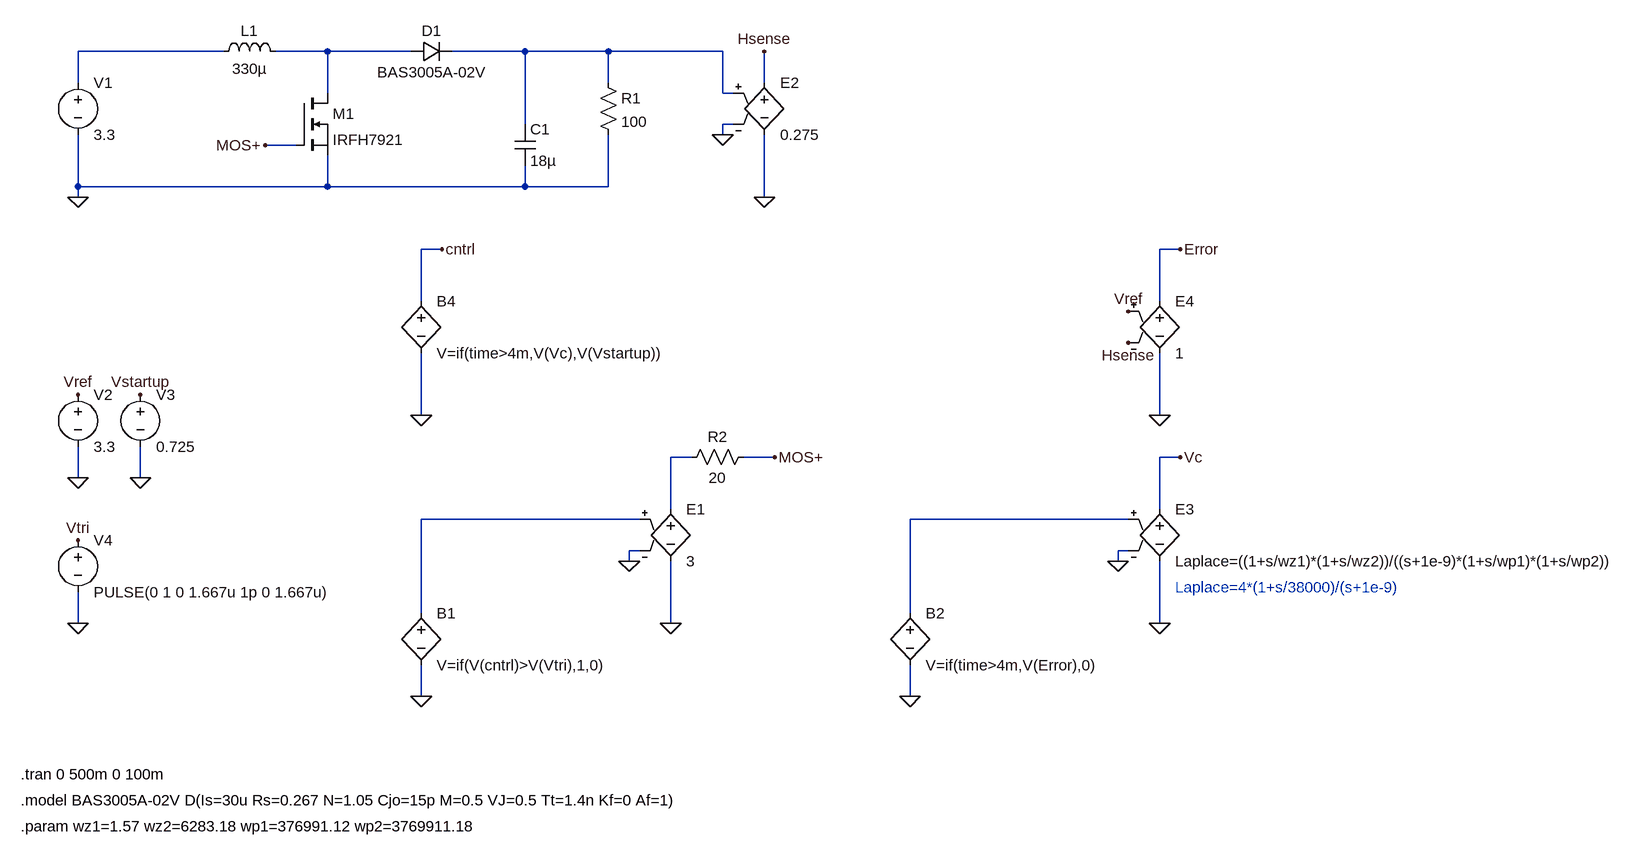
[diagram p0: schematic FDT closed loop.asc]
FDT closed loop.asc, the LTspice schematic file:
Version 4.1
SHEET 1 2152 680
WIRE -480 -576 -704 -576
WIRE -320 -576 -400 -576
WIRE -192 -576 -320 -576
WIRE -16 -576 -128 -576
WIRE 112 -576 -16 -576
WIRE 288 -576 112 -576
WIRE -704 -528 -704 -576
WIRE 112 -528 112 -576
WIRE 352 -528 352 -576
WIRE -320 -512 -320 -576
WIRE 288 -512 288 -576
WIRE 304 -512 288 -512
WIRE -16 -464 -16 -576
WIRE 304 -464 288 -464
WIRE 288 -448 288 -464
WIRE -368 -432 -416 -432
WIRE -704 -368 -704 -448
WIRE -320 -368 -320 -416
WIRE -320 -368 -704 -368
WIRE -16 -368 -16 -400
WIRE -16 -368 -320 -368
WIRE 112 -368 112 -448
WIRE 112 -368 -16 -368
WIRE -704 -352 -704 -368
WIRE 352 -352 352 -448
WIRE -144 -272 -176 -272
WIRE 992 -272 960 -272
WIRE -176 -192 -176 -272
WIRE 960 -192 960 -272
WIRE -176 -16 -176 -112
WIRE 960 -16 960 -112
WIRE 240 48 208 48
WIRE 368 48 320 48
WIRE 992 48 960 48
WIRE -704 80 -704 32
WIRE -608 80 -608 32
WIRE 208 128 208 48
WIRE 960 128 960 48
WIRE 160 144 -176 144
WIRE 912 144 576 144
WIRE 160 192 144 192
WIRE 912 192 896 192
WIRE 144 208 144 192
WIRE 896 208 896 192
WIRE -176 288 -176 144
WIRE 576 288 576 144
WIRE -704 304 -704 256
WIRE 208 304 208 208
WIRE 960 304 960 208
WIRE -176 416 -176 368
WIRE 576 416 576 368
FLAG -416 -432 MOS+
FLAG -704 -352 0
FLAG -704 304 0
FLAG -704 176 Vtri
FLAG -704 80 0
FLAG -704 -48 Vref
FLAG -176 416 0
FLAG 368 48 MOS+
FLAG 208 304 0
FLAG 144 208 0
FLAG 288 -448 0
FLAG 352 -352 0
FLAG 352 -576 Hsense
FLAG 960 304 0
FLAG 896 208 0
FLAG 960 -16 0
FLAG 992 -272 Error
FLAG 912 -176 Vref
FLAG 576 416 0
FLAG 992 48 Vc
FLAG -608 80 0
FLAG -608 -48 Vstartup
FLAG 912 -128 Hsense
FLAG -176 -16 0
FLAG -144 -272 cntrl
SYMBOL voltage -704 -544 R0
WINDOW 123 0 0 Left 0
WINDOW 39 0 0 Left 0
SYMATTR InstName V1
SYMATTR Value 3.3
SYMBOL ind -496 -560 R270
WINDOW 0 32 56 VTop 2
WINDOW 3 5 56 VBottom 2
SYMATTR InstName L1
SYMATTR Value 330µ
SYMBOL diode -192 -560 R270
WINDOW 0 32 32 VTop 2
WINDOW 3 0 32 VBottom 2
SYMATTR InstName D1
SYMATTR Value BAS3005A-02V
SYMBOL cap -32 -464 R0
SYMATTR InstName C1
SYMATTR Value 18µ
SYMBOL res 96 -544 R0
SYMATTR InstName R1
SYMATTR Value 100
SYMBOL nmos -368 -512 R0
SYMATTR InstName M1
SYMATTR Value IRFH7921
SYMBOL voltage -704 160 R0
WINDOW 123 0 0 Left 0
WINDOW 39 0 0 Left 0
SYMATTR InstName V4
SYMATTR Value PULSE(0 1 0 1.667u 1p 0 1.667u)
SYMBOL voltage -704 -64 R0
WINDOW 123 0 0 Left 0
WINDOW 39 0 0 Left 0
SYMATTR InstName V2
SYMATTR Value 3.3
SYMBOL bv -176 272 R0
SYMATTR InstName B1
SYMATTR Value V=if(V(cntrl)>V(Vtri),1,0)
SYMBOL e 208 112 R0
SYMATTR InstName E1
SYMATTR Value 3
SYMBOL e 352 -544 R0
SYMATTR InstName E2
SYMATTR Value 0.275
SYMBOL e 960 112 R0
SYMATTR InstName E3
SYMATTR Value Laplace=((1+s/wz1)*(1+s/wz2))/((s+1e-9)*(1+s/wp1)*(1+s/wp2))
SYMBOL e 960 -208 R0
SYMATTR InstName E4
SYMATTR Value 1
SYMBOL bv 576 272 R0
SYMATTR InstName B2
SYMATTR Value V=if(time>4m,V(Error),0)
SYMBOL voltage -608 -64 R0
WINDOW 123 0 0 Left 0
WINDOW 39 0 0 Left 0
SYMATTR InstName V3
SYMATTR Value 0.725
SYMBOL res 336 32 R90
WINDOW 0 0 56 VBottom 2
WINDOW 3 32 56 VTop 2
SYMATTR InstName R2
SYMATTR Value 20
SYMBOL bv -176 -208 R0
SYMATTR InstName B4
SYMATTR Value V=if(time>4m,V(Vc),V(Vstartup))
TEXT -792 536 Left 2 !.tran 0 500m 0 100m
TEXT -792 576 Left 2 !.model BAS3005A-02V D(Is=30u Rs=0.267 N=1.05 Cjo=15p M=0.5 VJ=0.5 Tt=1.4n Kf=0 Af=1)
TEXT -792 616 Left 2 !.param wz1=1.57 wz2=6283.18 wp1=376991.12 wp2=3769911.18
TEXT 984 248 Left 2 ;Laplace=4*(1+s/38000)/(s+1e-9)

The netlist it stands for:
* FDT closed loop.asc
V1 N001 0 3.3
L1 N001 N002 330µ
D1 N002 N003 BAS3005A-02V
C1 N003 0 18µ
R1 N003 0 100
M1 N002 MOS+ 0 0 IRFH7921
V4 Vtri 0 PULSE(0 1 0 1.667u 1p 0 1.667u)
V2 Vref 0 3.3
B1 N005 0 V=if(V(cntrl)>V(Vtri),1,0)
E1 N004 0 N005 0 3
E2 Hsense 0 N003 0 0.275
E3 Vc 0 N006 0 Laplace=((1+s/wz1)*(1+s/wz2))/((s+1e-9)*(1+s/wp1)*(1+s/wp2))
E4 Error 0 Vref Hsense 1
B2 N006 0 V=if(time>4m,V(Error),0)
V3 Vstartup 0 0.725
R2 MOS+ N004 20
B4 cntrl 0 V=if(time>4m,V(Vc),V(Vstartup))
.model D D
.lib standard.dio
.model NMOS NMOS
.model PMOS PMOS
.lib standard.mos
.tran 0 500m 0 100m
.model BAS3005A-02V D(Is=30u Rs=0.267 N=1.05 Cjo=15p M=0.5 VJ=0.5 Tt=1.4n Kf=0 Af=1)
.param wz1=1.57 wz2=6283.18 wp1=376991.12 wp2=3769911.18
* Laplace=4*(1+s/38000)/(s+1e-9)
.backanno
.end